# Altium schematic sheet 2_存储.schdoc
size 307 x 218 mm; Symbol: Drawing-Symbol_A4; Device: Drawing-Symbol_A4; Company: 嘉立创EDA; Version: V1.0; Page Size: A4; @Project Name: stm32f4; @Page Count: 3; @Update Date: 2025-11-04; @Create Date: 2025-10-30; @Schematic Name: Schematic1; @Page No: 2; @Page Name: 存储; @Create Time: 11:16:23; @Update Time: 20:28:53; Width: 1170; Height: 825; Region Start: 1; X Region Count: 6; Y Region Count: 4; Blade Width: 10; Title Block Position: 3; @Board Name: Board1
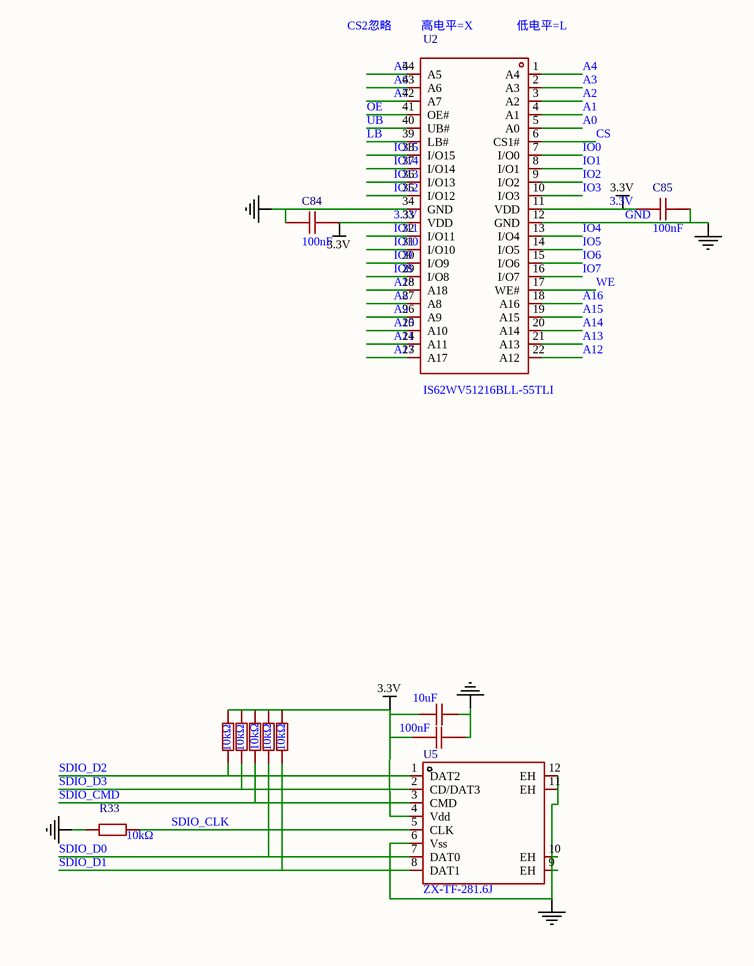
[diagram p0: 2_存储.schdoc]

## Parts
C3  10uF  [C0603]
C4  100nF  [C0402]
C84  100nF  [C0603]
C85  100nF  [C0603]
R28  10kΩ  [R0402]
R29  10kΩ  [R0402]
R30  10kΩ  [R0402]
R31  10kΩ  [R0402]
R32  10kΩ  [R0402]
R33  10kΩ  [R0402]
U2  IS62WV51216BLL-55TLI  [TSOP-44_L18.4-W10.2-P0.80-LS11.8-BL]
U5  ZX-TF-281.6J  [TF-SMD_ZX-TF-281.6J]

## Nets
3.3V: C3.2 C4.2 C84.1 C85.2 R28.2 R29.2 R30.2 R31.2 R32.2 U2.11(VDD) U2.33(VDD) U5.4(Vdd)
GND: C3.1 C4.1 C84.2 C85.1 R33.2 U2.12(GND) U2.34(GND) U5.6(Vss) U5.9(EH) U5.10(EH) U5.11(EH) U5.12(EH)
A0: U2.5(A0)
A1: U2.4(A1)
A2: U2.3(A2)
A3: U2.2(A3)
A4: U2.1(A4)
A5: U2.44(A5)
A6: U2.43(A6)
A7: U2.42(A7)
A8: U2.27(A8)
A9: U2.26(A9)
A10: U2.25(A10)
A11: U2.24(A11)
A12: U2.22(A12)
A13: U2.21(A13)
A14: U2.20(A14)
A15: U2.19(A15)
A16: U2.18(A16)
A17: U2.23(A17)
A18: U2.28(A18)
CS: U2.6(CS1#)
IO0: U2.7(I/O0)
IO1: U2.8(I/O1)
IO2: U2.9(I/O2)
IO3: U2.10(I/O3)
IO4: U2.13(I/O4)
IO5: U2.14(I/O5)
IO6: U2.15(I/O6)
IO7: U2.16(I/O7)
IO8: U2.29(I/O8)
IO9: U2.30(I/O9)
IO10: U2.31(I/O10)
IO11: U2.32(I/O11)
IO12: U2.35(I/O12)
IO13: U2.36(I/O13)
IO14: U2.37(I/O14)
IO15: U2.38(I/O15)
LB: U2.39(LB#)
OE: U2.41(OE#)
SDIO_CLK: R33.1 U5.5(CLK)
SDIO_CMD: R30.1 U5.3(CMD)
SDIO_D0: R29.1 U5.7(DAT0)
SDIO_D1: R28.1 U5.8(DAT1)
SDIO_D2: R32.1 U5.1(DAT2)
SDIO_D3: R31.1 U5.2(CD/DAT3)
UB: U2.40(UB#)
WE: U2.17(WE#)

## Notes on the sheet
- (near U2) CS2忽略
- (near U2) 高电平=X
- (near U2) 低电平=L
- 1
- 2
- 3
- 4
- 5
- 6
- A
- B
- C
- 原理图
- Schematic1
- 创建日期
- 更新日期
- 2025-10-30
- 2025-11-04
- 板子
- 绘制
- Board1
- 图页
- 存储
- D
- 审阅
- 版本
- 尺寸
- stm32f4
- 页    2    共    3
- V1.0
- A4
- 嘉立创EDA

## Library data of the parts
C3 = 0603X106K100NT: Manufacturer: FH(风华); Add into BOM: yes; Tolerance: ±10%; Voltage Rated: 10V; Temperature Coefficient: X5R; Symbol: 0603X106K100NT; Device: 0603X106K100NT; LCSC Part Name: 10uF ±10% 10V; Supplier Part: C38898; Manufacturer Part: 0603X106K100NT; Supplier Footprint: 0603; Datasheet: https://atta.szlcsc.com/upload/public/pdf/source/20170923/C38898_1506149449306988751.pdf; Supplier: LCSC; Convert to PCB: yes; Value: 10uF
C4 = CC0402KRX7R7BB104: Manufacturer: YAGEO(国巨); Add into BOM: yes; Tolerance: ±10%; Voltage Rated: 16V; Temperature Coefficient: X7R; Symbol: CC0402KRX7R7BB104; Device: CC0402KRX7R7BB104; LCSC Part Name: 100nF ±10% 16V; Supplier Part: C60474; Manufacturer Part: CC0402KRX7R7BB104; Supplier Footprint: 0402; Datasheet: https://atta.szlcsc.com/upload/public/pdf/source/20211223/9278FD768280B81DDBEF48FA36411A03.pdf; Supplier: LCSC; Convert to PCB: yes; Value: 100nF
C84 C85 = CC0603KRX7R9BB104: Manufacturer: YAGEO(国巨); Add into BOM: yes; Tolerance: ±10%; Voltage Rated: 50V; Temperature Coefficient: X7R; Symbol: CC0603KRX7R9BB104; Device: CC0603KRX7R9BB104; LCSC Part Name: 100nF ±10% 50V; Supplier Part: C14663; Manufacturer Part: CC0603KRX7R9BB104; Supplier Footprint: 0603; JLCPCB Part Class: 基础库; Datasheet: https://atta.szlcsc.com/upload/public/pdf/source/20180910/C282072_33301C7F631E79921B82A8DAC6BCC5B3.pdf; Supplier: LCSC; Convert to PCB: yes; Value: 100nF
R28-R33 = 0402WGF1002TCE: Manufacturer: UNI-ROYAL(厚声); Add into BOM: yes; Tolerance: ±1%; Power(Watts): 62.5mW; Voltage-Supply(Max): 50V; Temperature Coefficient: ±100ppm/℃; Symbol: 0402WGF1002TCE; Device: 0402WGF1002TCE; LCSC Part Name: 10kΩ ±1% 62.5mW 厚膜电阻; Supplier Part: C25744; Manufacturer Part: 0402WGF1002TCE; Supplier Footprint: 0402; JLCPCB Part Class: 基础库; Datasheet: https://item.szlcsc.com/datasheet/0402WGF1002TCE/26487.html; Supplier: LCSC; Convert to PCB: yes; Type: 厚膜电阻; Value: 10kΩ; Operating Temperature: -55℃~+155℃
U2 = IS62WV51216BLL-55TLI: Manufacturer: ISSI(美国芯成); Add into BOM: yes; Symbol: IS62WV51216BLL-55TLI; Device: IS62WV51216BLL-55TLI; LCSC Part Name: IS62WV51216BLL-55TLI; Supplier Part: C11315; Manufacturer Part: IS62WV51216BLL-55TLI; Supplier Footprint: TSOP-44-10.2mm; JLCPCB Part Class: 扩展库; Datasheet: https://item.szlcsc.com/datasheet/IS62WV51216BLL-55TLI/11868.html; Supplier: LCSC; Convert to PCB: yes
U5 = ZX-TF-281.6J: Manufacturer: Megastar(兆星); Add into BOM: yes; Card Connection Mode: 翻盖式; Card Type: MicroSD卡(TF卡); Connector Type: 卡座; Symbol: ZX-TF-281.6J; Device: ZX-TF-281.6J; LCSC Part Name: 翻盖式 MicroSD卡(TF卡) 卡座; Supplier Part: C7419839; Manufacturer Part: ZX-TF-281.6J; Supplier Footprint: SMD; JLCPCB Part Class: 扩展库; Datasheet: https://item.szlcsc.com/datasheet/ZX-TF-281.6J/8394861.html; Supplier: LCSC; Convert to PCB: yes; Height Above Board: 1.8mm; Operating Temperature: -25℃~+85℃